# Altium schematic sheet WIFI_BT PHY.schdoc
size 297 x 209 mm; Symbol: Drawing-Symbol_A4; Company: 嘉立创EDA; Version: V1.0; Page Size: A4; @Project Name: RK3566; @Update Date: 2026-10-03; @Create Date: 2026-05-22; Device: Drawing-Symbol_A4; @Board Name: Board1; @Page Name: P2; @Create Time: 17:39:22; @Page Count: 4; @Page No: 4; @Schematic Name: Schematic1; @Update Time: 17:39:22; @Assembly Variant: Basic; Border: 1; Title Block Position: 3; Size: A4; Width: 1170; Height: 825; Region Start: 1; X Region Count: 6; Y Region Count: 4; Blade Width: 10; SheetNumber: 6; SheetTotal: 11
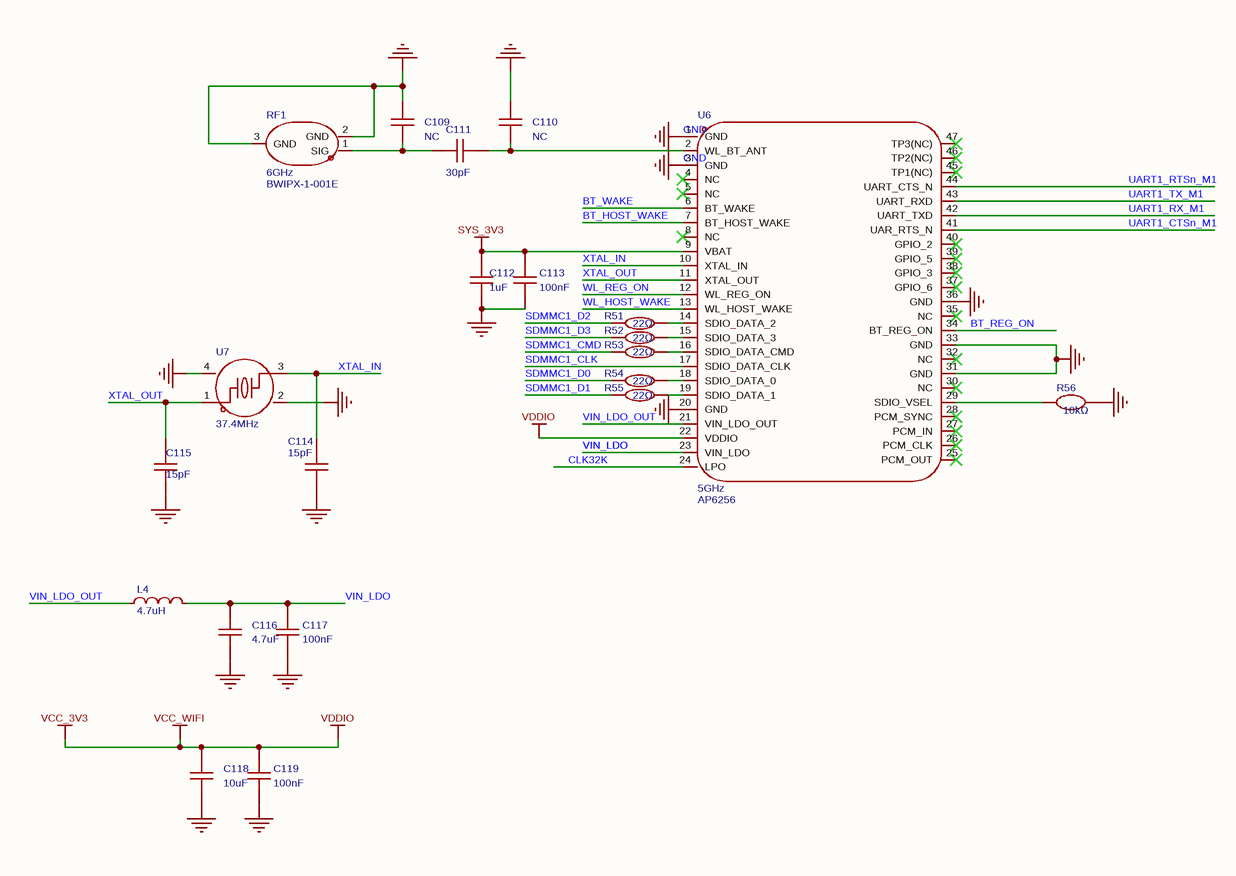
[diagram p0: WIFI_BT PHY.schdoc]

## Parts
C109  NC  [C0402]
C110  NC  [C0402]
C111  30pF  [C0402]
C112  1uF  [C0402]
C113  100nF  [C0402]
C114  15pF  [C0402]
C115  15pF  [C0402]
C116  4.7uF  [C0402]
C117  100nF  [C0402]
C118  10uF  [C0402]
C119  100nF  [C0402]
L4  4.7uH  [L0805]
R51  22Ω  [R0402]
R52  22Ω  [R0402]
R53  22Ω  [R0402]
R54  22Ω  [R0402]
R55  22Ω  [R0402]
R56  10kΩ  [R0402]
RF1  6GHz  [IPEX-SMD_BWIPX-1-001E]
U6  5GHz  [QFN-44_L12.0-W12.0-P0.90-TL_AP6256]
U7  37.4MHz  [OSC-SMD_4P-L1.6-W1.2-BL-1]

## Nets
GND: C109.2 C110.2 C112.1 C113.1 C114.1 C115.1 C116.1 C117.1 C118.1 C119.1 R56.2 RF1.2(GND) RF1.3(GND) U6.1(GND) U6.3(GND) U6.20(GND) U6.31(GND) U6.33(GND) U6.36(GND) U7.2(GND) U7.4(GND)
SYS_3V3: C112.2 C113.2 U6.9(VBAT)
VCC_3V3: C118.2 C119.2 U6.22(VDDIO)  [also labelled VCC_WIFI, VDDIO]
BT_HOST_WAKE: U6.7(BT_HOST_WAKE)
BT_REG_ON: U6.34(BT_REG_ON)
BT_WAKE: U6.6(BT_WAKE)
CLK32K: U6.24(LPO)
SDMMC1_CLK: U6.17(SDIO_DATA_CLK)
SDMMC1_CMD: R53.1
SDMMC1_D0: R54.1
SDMMC1_D1: R55.1
SDMMC1_D2: R51.1
SDMMC1_D3: R52.1
UART1_CTSn_M1: U6.41(UAR_RTS_N)
UART1_RTSn_M1: U6.44(UART_CTS_N)
UART1_RX_M1: U6.42(UART_TXD)
UART1_TX_M1: U6.43(UART_RXD)
VIN_LDO: C116.2 C117.2 L4.2 U6.23(VIN_LDO)
VIN_LDO_OUT: L4.1 U6.21(VIN_LDO_OUT)
WL_HOST_WAKE: U6.13(WL_HOST_WAKE)
WL_REG_ON: U6.12(WL_REG_ON)
XTAL_IN: C114.2 U6.10(XTAL_IN) U7.3
XTAL_OUT: C115.2 U6.11(XTAL_OUT) U7.1
NetC109_1: C109.1 C111.1 RF1.1(SIG)
NetC110_1: C110.1 C111.2 U6.2(WL_BT_ANT)
NetR51_2: R51.2 U6.14(SDIO_DATA_2)
NetR52_2: R52.2 U6.15(SDIO_DATA_3)
NetR53_2: R53.2 U6.16(SDIO_DATA_CMD)
NetR54_2: R54.2 U6.18(SDIO_DATA_0)
NetR55_2: R55.2 U6.19(SDIO_DATA_1)
NetR56_1: R56.1 U6.29(SDIO_VSEL)

Not connected (* = marked no-connect by the designer): U6 4(NC)* 5(NC)* 8(NC)* 25(PCM_OUT)* 26(PCM_CLK)* 27(PCM_IN)* 28(PCM_SYNC)* 30(NC)* 32(NC)* 35(NC)* 37(GPIO_6)* 38(GPIO_3)* 39(GPIO_5)* 40(GPIO_2)* 45(TP1(NC))* 46(TP2(NC))* 47(TP3(NC))*

## Notes on the sheet
- 创建日期
- 2026-10-03
- 原理图
- 板子
- Schematic1
- Board1
- 更新日期
- 图页
- P2
- 绘制
- 审阅
- RK3566
- 版本
- V1.0
- 尺寸
- A4
- 页    4    共    4
- 嘉立创EDA

## Library data of the parts
C109 C110 = CC0402JRNPO9BN100: 容值:10pF;精度:±5%;额定电压:50V;温度系数:NP0;; Manufacturer: YAGEO(国巨); AddInBom: yes; ModelId: 36a51122f27c49738f86b3bfa98863e0聨0819f05c4eef4c71ace90d822a990e87; ModelName: C0402_L1.0-W0.5-H0.5; ModelTransform: 39.37,19.685,0,0,0,0,0,0,0; Tolerance: ±5%; Voltage Rating: 50V; Temperature Coefficient: NP0; Symbol: CC0402JRNPO9BN100; Device: CC0402JRNPO9BN100; Value: NC; LCSC Part Name: 10pF ±5% 50V; ManufacturerPart: CC0402JRNPO9BN100; Supplier Footprint: 0402; JLCPCB Part Class: Extended Part; Datasheet: https://item.szlcsc.com/datasheet/CC0402JRNPO9BN100/107414.html; Supplier: LCSC; ConvertToPcb: yes; FootprintName: C0402
C111 = CC0402FRNPO9BN300: 容值:30pF;精度:±1%;额定电压:50V;材质(温度系数):NP0;; Manufacturer: YAGEO(国巨); AddInBom: yes; ModelId: 36a51122f27c49738f86b3bfa98863e0聨0819f05c4eef4c71ace90d822a990e87; ModelName: C0402_L1.0-W0.5-H0.5; ModelTransform: 39.37,19.685,0,0,0,0,0,0,0; Tolerance: ±1%; Voltage Rated: 50V; Temperature Coefficient: NP0; Symbol: CC0402FRNPO9BN300; Device: CC0402FRNPO9BN300; LCSC Part Name: 30pF ±1% 50V; SupplierPart: C526980; ManufacturerPart: CC0402FRNPO9BN300; Supplier Footprint: 0402; JLCPCB Part Class: Extended Part; Datasheet: https://atta.szlcsc.com/upload/public/pdf/source/20200508/C526980_8BD9B2380CFF3BD9993DEB032B356E9B.pdf; Supplier: LCSC; ConvertToPcb: yes; FootprintName: C0402; Value: 30pF
C112 = HGC0402R5105K500NTEJ: 容值:1uF;精度:±10%;额定电压:50V;温度系数:X5R;; Manufacturer: Chinocera(华瓷); 3D Model: 36a51122f27c49738f86b3bfa98863e0聨0819f05c4eef4c71ace90d822a990e87; 3D Model Transform: 39.37,19.685,0,0,0,0,0,0,0; Tolerance: ±10%; Voltage Rating: 50V; Temperature Coefficient: X5R; AddInBom: yes; ModelName: C0402_L1.0-W0.5-H0.5; Symbol: HGC0402R5105K500NTEJ; Device: HGC0402R5105K500NTEJ; LCSC Part Name: 1uF ±10% 50V; Supplier Part: C7472948; Manufacturer Part: HGC0402R5105K500NTEJ; Supplier Footprint: 0402; JLCPCB Part Class: Extended Part; Datasheet: https://item.szlcsc.com/datasheet/HGC0402R5105K500NTEJ/8532795.html; Supplier: LCSC; Value: 1uF; ConvertToPcb: yes; FootprintName: C0402
C113 C117 C119 = CL05B104KO5NNNC: 容值:100nF;精度:±10%;额定电压:16V;温度系数:X7R;; Manufacturer: SAMSUNG(三星); 3D Model: 36a51122f27c49738f86b3bfa98863e0聨0819f05c4eef4c71ace90d822a990e87; 3D Model Transform: 39.37,19.685,0,0,0,0,0,0,0; Tolerance: ±10%; Voltage Rating: 16V; Temperature Coefficient: X7R; AddInBom: yes; ModelName: C0402_L1.0-W0.5-H0.5; Symbol: CL05B104KO5NNNC; Device: CL05B104KO5NNNC; LCSC Part Name: 100nF ±10% 16V; Supplier Part: C1525; Manufacturer Part: CL05B104KO5NNNC; Supplier Footprint: 0402; JLCPCB Part Class: Basic Part; Datasheet: https://item.szlcsc.com/datasheet/CL05B104KO5NNNC/1877.html; Supplier: LCSC; Value: 100nF; ConvertToPcb: yes; FootprintName: C0402
C114 C115 = CC0402FRNPO9BN150: 容值:15pF;精度:±1%;额定电压:50V;温度系数:NP0;; Manufacturer: YAGEO(国巨); AddInBom: yes; ModelId: 36a51122f27c49738f86b3bfa98863e0聨0819f05c4eef4c71ace90d822a990e87; ModelName: C0402_L1.0-W0.5-H0.5; ModelTransform: 39.37,19.685,0,0,0,0,0,0,0; Tolerance: ±1%; Voltage Rating: 50V; Temperature Coefficient: NP0; Symbol: CC0402FRNPO9BN150; Device: CC0402FRNPO9BN150; LCSC Part Name: 15pF ±1% 50V; SupplierPart: C326803; ManufacturerPart: CC0402FRNPO9BN150; Supplier Footprint: 0402; JLCPCB Part Class: Extended Part; Datasheet: https://item.szlcsc.com/datasheet/CC0402FRNPO9BN150/306897.html; Supplier: LCSC; ConvertToPcb: yes; FootprintName: C0402; Value: 15pF
C116 = CGA0402X5R475M250GT: 容值:4.7uF;精度:±20%;额定电压:25V;温度系数:X5R;; Manufacturer: HRE(芯声); AddInBom: yes; ModelId: 36a51122f27c49738f86b3bfa98863e0聨0819f05c4eef4c71ace90d822a990e87; ModelName: C0402_L1.0-W0.5-H0.5; ModelTransform: 39.37,19.685,0,0,0,0,0,0,0; Tolerance: ±20%; Voltage Rating: 25V; Temperature Coefficient: X5R; Symbol: CGA0402X5R475M250GT; Device: CGA0402X5R475M250GT; LCSC Part Name: 4.7uF ±20% 25V; SupplierPart: C6119795; ManufacturerPart: CGA0402X5R475M250GT; Supplier Footprint: 0402; JLCPCB Part Class: Extended Part; Datasheet: https://item.szlcsc.com/datasheet/CGA0402X5R475M250GT/7062501.html; Supplier: LCSC; ConvertToPcb: yes; FootprintName: C0402; Value: 4.7uF
C118 = HGC0402R5106M100NTEJ: 容值:10uF;精度:±20%;额定电压:10V;温度系数:X5R;; Manufacturer: Chinocera(华瓷); 3D Model: 36a51122f27c49738f86b3bfa98863e0聨0819f05c4eef4c71ace90d822a990e87; 3D Model Transform: 39.37,19.685,0,0,0,0,0,0,0; Tolerance: ±20%; Voltage Rating: 10V; Temperature Coefficient: X5R; AddInBom: yes; ModelName: C0402_L1.0-W0.5-H0.5; Symbol: HGC0402R5106M100NTEJ; Device: HGC0402R5106M100NTEJ; LCSC Part Name: 10uF ±20% 10V; Supplier Part: C7472949; Manufacturer Part: HGC0402R5106M100NTEJ; Supplier Footprint: 0402; JLCPCB Part Class: Extended Part; Datasheet: https://item.szlcsc.com/datasheet/HGC0402R5106M100NTEJ/8532796.html; Supplier: LCSC; Value: 10uF; ConvertToPcb: yes; FootprintName: C0402
L4 = MPL2012S4R7MHT: 电感值:4.7uH;精度:±20%;额定电流:800mA;类型:叠层电感;; Manufacturer: Sunlord(顺络); AddInBom: yes; ModelId: 37a81e68749a4138bd2dfa6897b24b85聨0819f05c4eef4c71ace90d822a990e87; ModelName: R0805_L2.0-W1.3-H0.6; ModelTransform: 78.74,51.181,0,0,0,0,0,0.001,0; Tolerance: ±20%; Current Rating: 800mA; DC Resistance(DCR): 250mΩ; Type: 叠层电感; Symbol: MPL2012S4R7MHT; Device: MPL2012S4R7MHT; LCSC Part Name: 4.7uH ±20%; SupplierPart: C63166; ManufacturerPart: MPL2012S4R7MHT; Supplier Footprint: 0805; JLCPCB Part Class: Extended Part; Datasheet: https://item.szlcsc.com/datasheet/MPL2012S4R7MHT/64229.html; Supplier: LCSC; ConvertToPcb: yes; FootprintName: L0805; Value: 4.7uH
R51-R55 = RC0402FR-0722RL: 电阻类型:厚膜电阻;阻值:22Ω;精度:±1%;功率:62.5mW;工作电压:50V;温度系数:±100ppm/℃;; Manufacturer: YAGEO(国巨); 3D Model: 98c88bc2b9094f218f3a3e30a7012738聨0819f05c4eef4c71ace90d822a990e87; 3D Model Transform: 39.37,19.685,0,0,0,0,0,0,0; Tolerance: ±1%; Power(Watts): 62.5mW; Voltage-Supply(Max): 50V; AddInBom: yes; ModelName: R0402_L1.0-W0.5-H0.4; Symbol: RC0402FR-0722RL; Device: RC0402FR-0722RL; LCSC Part Name: 厚膜电阻 22Ω ±1% 62.5mW; Supplier Part: C114765; Manufacturer Part: RC0402FR-0722RL; Supplier Footprint: 0402; JLCPCB Part Class: Extended Part; Datasheet: https://item.szlcsc.com/datasheet/RC0402FR-0722RL/116009.html; Supplier: LCSC; Type: 厚膜电阻; Value: 22Ω; Temperature Coefficient: ±100ppm/℃; Operating Temperature: -55℃~+155℃; ConvertToPcb: yes; FootprintName: R0402
R56 = FRC0402F1002TS: 电阻类型:厚膜电阻;阻值:10kΩ;精度:±1%;功率:62.5mW;工作电压:50V;温度系数:±100ppm/℃;; Manufacturer: FOJAN(富捷); AddInBom: yes; ModelId: 98c88bc2b9094f218f3a3e30a7012738聨0819f05c4eef4c71ace90d822a990e87; ModelName: R0402_L1.0-W0.5-H0.4; ModelTransform: 39.37,19.685,0,0,0,0,0,0,0; Tolerance: ±1%; Power(Watts): 62.5mW; Voltage-Supply(Max): 50V; Symbol: FRC0402F1002TS; Device: FRC0402F1002TS; LCSC Part Name: 10kΩ ±1% 62.5mW 厚膜电阻; SupplierPart: C2906861; ManufacturerPart: FRC0402F1002TS; Supplier Footprint: 0402; JLCPCB Part Class: Extended Part; Datasheet: https://item.szlcsc.com/datasheet/FRC0402F1002TS/3180374.html; Supplier: LCSC; ConvertToPcb: yes; FootprintName: R0402; Type: 厚膜电阻; Value: 10kΩ; Temperature Coefficient: ±100ppm/℃; Operating Temperature: -55℃~+155℃
RF1 = BWIPX-1-001E: 连接器类型:板端;接口类型:内针;端口数量:1;接口直径:2mm;接口长度/高度:1.25mm;频率:6GHz;射频系列:IPEX;阻抗:50Ω;样式:-;工作温度:-40℃~+85℃;; Manufacturer: BAT WIRELESS(蝙蝠无线); AddInBom: yes; ModelId: e9910d1cc3f644ef905f39c3184653d7聨0819f05c4eef4c71ace90d822a990e87; ModelTransform: 122.047,118.11,0,180,0,0,29.921,0,0; Connector Type: 板端; Interface: 内针; Number of Ports: 1; Interface Diameter: 2mm; Interface Length/Height: 1.25mm; RF Series: IPEX; Impedance: 50Ω; Symbol: BWIPX-1-001E; Device: BWIPX-1-001E; LCSC Part Name: 内针 IPEX; SupplierPart: C496552; ManufacturerPart: BWIPX-1-001E; Supplier Footprint: SMD; JLCPCB Part Class: Extended Part; Datasheet: https://item.szlcsc.com/datasheet/BWIPX-1-001E/508501.html; Supplier: LCSC; ConvertToPcb: yes; FootprintName: IPEX-SMD_BWIPX-1-001E; ModelName: IPEX-SMD_BWIPX-1-001E; Value: 6GHz; Style: -; Operating Temperature Range: -40℃~+85℃
U6 = AP6256: 核心芯片:BCM43456;频率:5GHz;发射功率:17dBm;接收灵敏度:-96dBm;; Manufacturer: AMPAK(正基科技); AddInBom: yes; Wireless Standard: IEEE802.11b/g/n；Bluetooth5.2; Interface Type: GPIO；PCM；SDIO；UART; Output Power: 17dBm; Voltage - Supply: 3.2V~4.8V; Sensitivity: -96dBm; Symbol: AP6256; Device: AP6256; LCSC Part Name: WIFI模块; SupplierPart: C5248079; ManufacturerPart: AP6256; Supplier Footprint: QFN-44(12x12); JLCPCB Part Class: Extended Part; Datasheet: https://item.szlcsc.com/datasheet/AP6256/5960630.html; Supplier: LCSC; ConvertToPcb: yes; FootprintName: QFN-44_L12.0-W12.0-P0.90-TL_AP6256; Utilized IC / Part: BCM43456; Value: 5GHz; Operating Temperature: -30℃~+85℃; Features: 集成蓝牙功能
U7 = SX16Y037400BC1T001: 晶振类型:贴片晶振;频率:37.4MHz;常温频差:±10ppm;负载电容:12pF;; Manufacturer: TKD(泰晶); AddInBom: yes; ModelId: b29ae56bafdc44b68620701fbba13e71聨0819f05c4eef4c71ace90d822a990e87; ModelTransform: 62.992,47.244,0,0,0,0,0,0,0; Normal temperature Frequency Tolerance: ±10ppm; Load Capacitance: 12pF; Equivalent Series Resistance(ESR): 60Ω; Symbol: SX16Y037400BC1T001; Device: SX16Y037400BC1T001; LCSC Part Name: 37.4MHz ±10ppm 12pF; SupplierPart: C20623632; ManufacturerPart: SX16Y037400BC1T001; Supplier Footprint: SMD1612-4P; JLCPCB Part Class: Extended Part; Datasheet: https://item.szlcsc.com/datasheet/SX16Y037400BC1T001/22021338.html; Supplier: LCSC; ConvertToPcb: yes; FootprintName: OSC-SMD_4P-L1.6-W1.2-BL-1; ModelName: OSC-SMD_4P-L1.6-W1.2-BL-1; Type: 贴片晶振; Value: 37.4MHz; Operating Temperature: -30℃~+85℃